# Altium schematic sheet MicroSDAdapter.SchDoc
size A; SheetNumber: 5; SheetTotal: 6
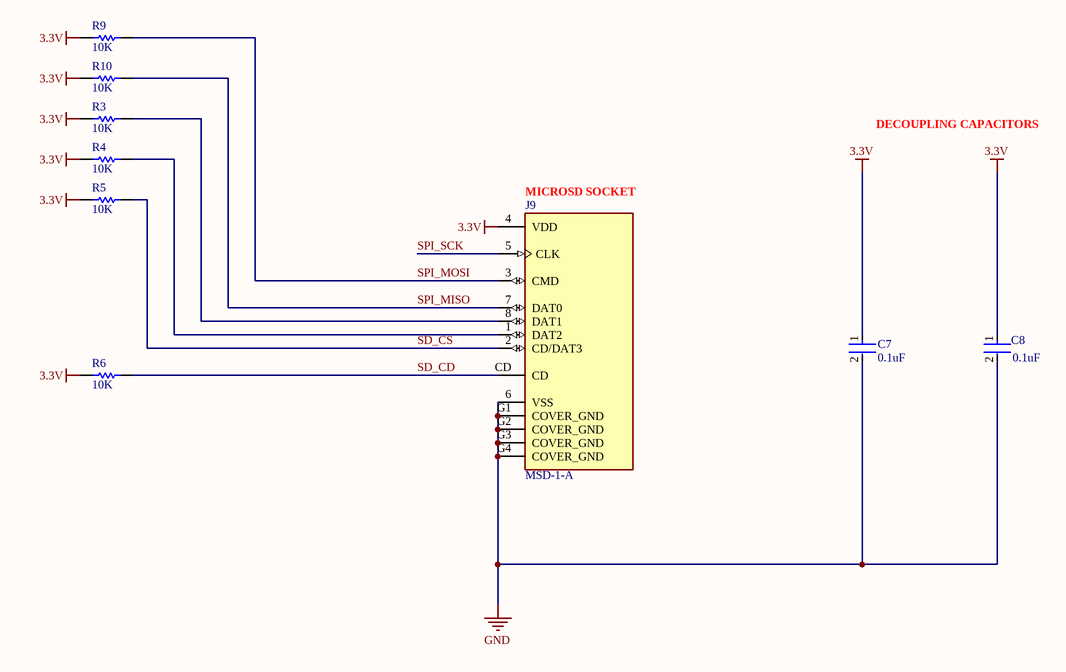
[diagram p0: MicroSDAdapter.SchDoc]

## Parts
C7  0.1uF  [FP-RHE1DB-MFG]
C8  0.1uF  [FP-RHE1DB-MFG]
J9  MSD-1-A  [CUI_MSD-1-A]
R3  10K  [RESA60-630X240]
R4  10K  [RESA60-630X240]
R5  10K  [RESA60-630X240]
R6  10K  [RESA60-630X240]
R9  10K  [RESA60-630X240]
R10  10K  [RESA60-630X240]

## Nets
3.3V: C7.1 C8.1 J9.4(VDD) R3.2 R4.2 R5.2 R6.2 R9.2 R10.2
GND: C7.2 C8.2 J9.6(VSS) J9.G1(COVER_GND) J9.G2(COVER_GND) J9.G3(COVER_GND) J9.G4(COVER_GND)
SD_CD: J9.CD R6.1
SD_CS: J9.2(CD/DAT3) R5.1
SPI_MISO: J9.7(DAT0) R10.1
SPI_MOSI: J9.3(CMD) R9.1
SPI_SCK: J9.5(CLK)
NetJ9_1: J9.1(DAT2) R4.1
NetJ9_8: J9.8(DAT1) R3.1

## Notes on the sheet
- DECOUPLING CAPACITORS
- (near J9) MICROSD SOCKET

## Library data of the parts
C7 C8 = CMP-06035-012170-1: Ceramic Capacitor Automotive 330nF ±10% 50V X8L Radial; Tolerance: 10%; Lead Pitch: 2.5mm; Capacitance: 330nF; Max Operating Temperature: 150°C; Dielectric: X8L; Voltage Rating: 50V; Voltage Rating (DC): 50V; Min Operating Temperature: -55°C; REACH SVHC: No SVHC
J9 = MSD-1-A: Micro SD Card Connector, 9 Positions, Connector and Ejector, Push In, Auto Eject Out, Surface Mount, 1.8 mm Height Above Board, Gold Flash; MF: Same Sky; SnapEDA_Link: https://www.snapeda.com/parts/MSD-1-A/Same+Sky/view-part/?ref=snap; Package: None; Value: *; MP: MSD-1-A; Check_prices: https://www.snapeda.com/parts/MSD-1-A/Same+Sky/view-part/?ref=eda
R3-R6 R9 R10 = CMP-1659-00070-1: Axial Resistor, 1 MOhm, +/- 1%, 250 mW, -55 to 155 degC, 2-Pin THD, RoHS, Bulk; Power Rating: 250 mW; Resistance: 47.5 kohm; Voltage Rating: 250 V; ComponentLink1Description: Manufacturer URL; PackageReference: MFR-25; ComponentLink2Description: Datasheet; ComponentLink2URL: http://www.yageo.com/documents/recent/Yageo%20LR_MFR_2013.pdf; Tolerance: 1%; DatasheetVersion: Apr-13; Package Quantity: 200; Packaging: Bulk; Case\Package: Axial; RoHSCompliant: true; ComponentLink1URL: http://www.yageo.com/; Length: 0.248 inch; Min Operating Temperature: -55 degC; Mount: Through Hole; PackageDescription: 2-Pin Axial Lead, Dia 2.4 mm, Body Length 6.3 mm; Max Operating Temperature: 155 degC